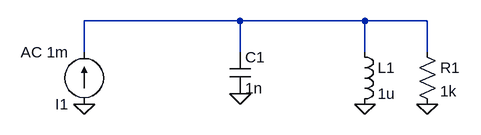
[diagram p0: schematic unseen_lc_tank.asc]
unseen_lc_tank.asc, the LTspice schematic file:
Version 4.1
SHEET 1 1600 1200
WIRE 80 64 80 16
WIRE 80 16 -160 16
WIRE -160 16 -160 64
WIRE 272 64 272 16
WIRE 272 16 80 16
WIRE 368 64 368 16
WIRE 368 16 272 16
FLAG -160 144 0
FLAG 272 144 0
FLAG 80 128 0
FLAG 368 144 0
SYMBOL cap 64 64 R0
SYMATTR InstName C1
SYMATTR Value 1n
SYMBOL current -160 144 R180
SYMATTR InstName I1
SYMATTR Value AC 1m
SYMBOL ind 256 48 R0
SYMATTR InstName L1
SYMATTR Value 1u
SYMBOL res 352 48 R0
SYMATTR InstName R1
SYMATTR Value 1k

The netlist it stands for:
* unseen_lc_tank.asc
C1 N001 0 1n
I1 0 N001 AC 1m
L1 N001 0 1u
R1 N001 0 1k
.backanno
.end